# Altium schematic sheet Thermocouple-Sheet.SchDoc
size A4; DocumentNumber: 3; SheetNumber: 3; SheetTotal: 8
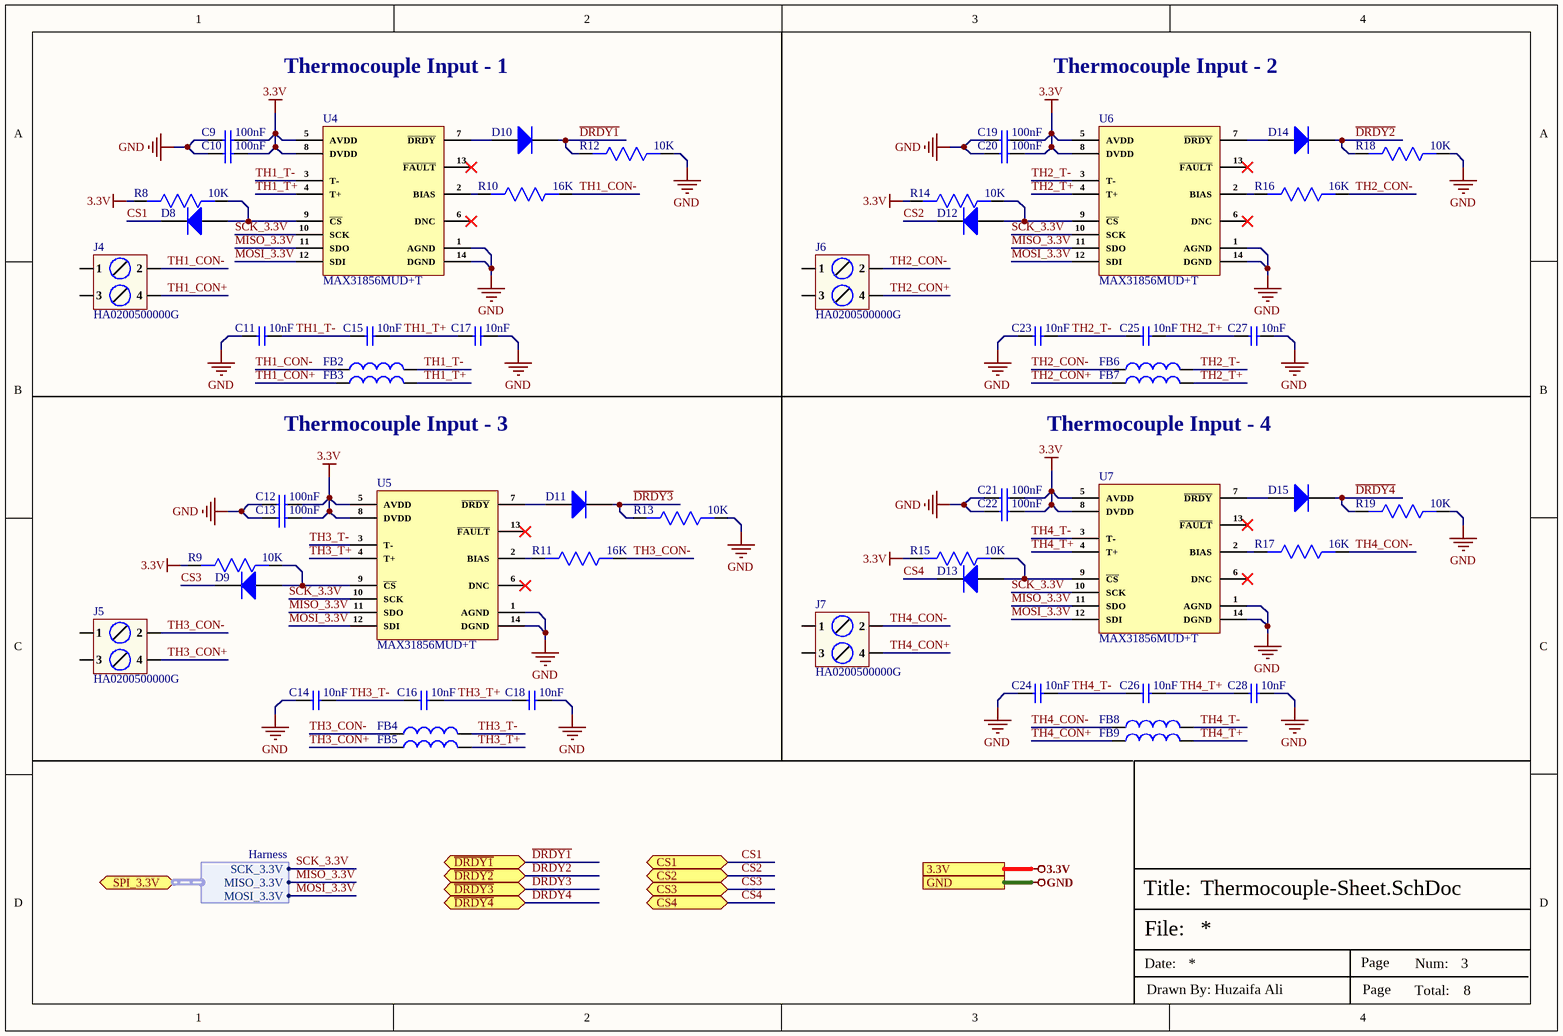
[diagram p0: Thermocouple-Sheet.SchDoc]

## Parts
C9  100nF  [Cap-0603]
C10  100nF  [Cap-0603]
C11  10nF  [Cap-0603]
C12  100nF  [Cap-0603]
C13  100nF  [Cap-0603]
C14  10nF  [Cap-0603]
C15  10nF  [Cap-0603]
C16  10nF  [Cap-0603]
C17  10nF  [Cap-0603]
C18  10nF  [Cap-0603]
C19  100nF  [Cap-0603]
C20  100nF  [Cap-0603]
C21  100nF  [Cap-0603]
C22  100nF  [Cap-0603]
C23  10nF  [Cap-0603]
C24  10nF  [Cap-0603]
C25  10nF  [Cap-0603]
C26  10nF  [Cap-0603]
C27  10nF  [Cap-0603]
C28  10nF  [Cap-0603]
D8  1N4148WS-7-F  [SOD-323]  (value not drawn)
D9  1N4148WS-7-F  [SOD-323]  (value not drawn)
D10  1N4148WS-7-F  [SOD-323]  (value not drawn)
D11  1N4148WS-7-F  [SOD-323]  (value not drawn)
D12  1N4148WS-7-F  [SOD-323]  (value not drawn)
D13  1N4148WS-7-F  [SOD-323]  (value not drawn)
D14  1N4148WS-7-F  [SOD-323]  (value not drawn)
D15  1N4148WS-7-F  [SOD-323]  (value not drawn)
FB2  MMZ2012R102ATD25  [Ind-0805]  (value not drawn)
FB3  MMZ2012R102ATD25  [Ind-0805]  (value not drawn)
FB4  MMZ2012R102ATD25  [Ind-0805]  (value not drawn)
FB5  MMZ2012R102ATD25  [Ind-0805]  (value not drawn)
FB6  MMZ2012R102ATD25  [Ind-0805]  (value not drawn)
FB7  MMZ2012R102ATD25  [Ind-0805]  (value not drawn)
FB8  MMZ2012R102ATD25  [Ind-0805]  (value not drawn)
FB9  MMZ2012R102ATD25  [Ind-0805]  (value not drawn)
J4  HA0200500000G  [HA0200500000G]
J5  HA0200500000G  [HA0200500000G]
J6  HA0200500000G  [HA0200500000G]
J7  HA0200500000G  [HA0200500000G]
R8  10K  [Res-0603]
R9  10K  [Res-0603]
R10  16K  [Res-0603]
R11  16K  [Res-0603]
R12  10K  [Res-0603]
R13  10K  [Res-0603]
R14  10K  [Res-0603]
R15  10K  [Res-0603]
R16  16K  [Res-0603]
R17  16K  [Res-0603]
R18  10K  [Res-0603]
R19  10K  [Res-0603]
U4  MAX31856MUD+T  [14-TSSOP]
U5  MAX31856MUD+T  [14-TSSOP]
U6  MAX31856MUD+T  [14-TSSOP]
U7  MAX31856MUD+T  [14-TSSOP]

## Ports
3.3V, CS1 (bidir), CS2 (bidir), CS3 (bidir), CS4 (bidir), GND, SPI_3.3V (bidir, harness Harness), ~{DRDY1} (bidir), ~{DRDY2} (bidir), ~{DRDY3} (bidir), ~{DRDY4} (bidir)

## Harnesses
Harness: SCK_3.3V, MISO_3.3V, MOSI_3.3V

## Nets
3.3V: C9.2 C10.2 C12.2 C13.2 C19.2 C20.2 C21.2 C22.2 R8.2 R9.2 R14.2 R15.2 U4.5(AVDD) U4.8(DVDD) U5.5(AVDD) U5.8(DVDD) U6.5(AVDD) U6.8(DVDD) U7.5(AVDD) U7.8(DVDD) ; port 3.3V
GND: C9.1 C10.1 C11.1 C12.1 C13.1 C14.1 C17.2 C18.2 C19.1 C20.1 C21.1 C22.1 C23.1 C24.1 C27.2 C28.2 R12.1 R13.1 R18.1 R19.1 U4.1(AGND) U4.14(DGND) U5.1(AGND) U5.14(DGND) U6.1(AGND) U6.14(DGND) U7.1(AGND) U7.14(DGND) ; port GND
CS1: D8.1(K) ; port CS1
CS2: D12.1(K) ; port CS2
CS3: D9.1(K) ; port CS3
CS4: D13.1(K) ; port CS4
~{DRDY1}: D10.1(K) R12.2 ; port ~{DRDY1}
~{DRDY2}: D14.1(K) R18.2 ; port ~{DRDY2}
~{DRDY3}: D11.1(K) R13.2 ; port ~{DRDY3}
~{DRDY4}: D15.1(K) R19.2 ; port ~{DRDY4}
MISO_3.3V: U4.11(SDO) U5.11(SDO) U6.11(SDO) U7.11(SDO) ; port SPI_3.3V.MISO_3.3V
MOSI_3.3V: U4.12(SDI) U5.12(SDI) U6.12(SDI) U7.12(SDI) ; port SPI_3.3V.MOSI_3.3V
SCK_3.3V: U4.10(SCK) U5.10(SCK) U6.10(SCK) U7.10(SCK) ; port SPI_3.3V.SCK_3.3V
TH1_CON+: FB3.1 J4.4
TH1_CON-: FB2.1 J4.2 R10.1
TH1_T+: C15.2 C17.1 FB3.2 U4.4(T+)
TH1_T-: C11.2 C15.1 FB2.2 U4.3(T-)
TH2_CON+: FB7.1 J6.4
TH2_CON-: FB6.1 J6.2 R16.1
TH2_T+: C25.2 C27.1 FB7.2 U6.4(T+)
TH2_T-: C23.2 C25.1 FB6.2 U6.3(T-)
TH3_CON+: FB5.1 J5.4
TH3_CON-: FB4.1 J5.2 R11.1
TH3_T+: C16.2 C18.1 FB5.2 U5.4(T+)
TH3_T-: C14.2 C16.1 FB4.2 U5.3(T-)
TH4_CON+: FB9.1 J7.4
TH4_CON-: FB8.1 J7.2 R17.1
TH4_T+: C26.2 C28.1 FB9.2 U7.4(T+)
TH4_T-: C24.2 C26.1 FB8.2 U7.3(T-)
NetD8_2: D8.2(A) R8.1 U4.9(~{CS})
NetD9_2: D9.2(A) R9.1 U5.9(~{CS})
NetD10_2: D10.2(A) U4.7(~{DRDY})
NetD11_2: D11.2(A) U5.7(~{DRDY})
NetD12_2: D12.2(A) R14.1 U6.9(~{CS})
NetD13_2: D13.2(A) R15.1 U7.9(~{CS})
NetD14_2: D14.2(A) U6.7(~{DRDY})
NetD15_2: D15.2(A) U7.7(~{DRDY})
NetR10_2: R10.2 U4.2(BIAS)
NetR11_2: R11.2 U5.2(BIAS)
NetR16_2: R16.2 U6.2(BIAS)
NetR17_2: R17.2 U7.2(BIAS)

Not connected (* = marked no-connect by the designer): J4 1 3; J5 1 3; J6 1 3; J7 1 3; U4 6(DNC)* 13(~{F}~{AULT})*; U5 6(DNC)* 13(~{F}~{AULT})*; U6 6(DNC)* 13(~{F}~{AULT})*; U7 6(DNC)* 13(~{F}~{AULT})*

## Notes on the sheet
- Thermocouple Input - 1
- Thermocouple Input - 2
- Thermocouple Input - 3
- Thermocouple Input - 4
- File:
- Title:
- Date:
- Page
- Num:
- Total:
- Drawn By: Huzaifa Ali

## Library data of the parts
C9 C10 C12 C13 C19-C22 = CC0603KRX5R9BB104: CAP CER 0.1UF 50V X5R 0603; Manufacturer: Yageo; Tolerance: 10%; Item Type: Capacitor; Supplier 1: Digi-Key; Manufacturer Part Number: CC0603KRX5R9BB104; RoHS: Yes; Category: Ceramic Capacitors; Stock 1: 152253; Pricing 1: 1=0.10000, 10=0.05200, 50=0.02820, 100=0.02310, 500=0.01648, 1000=0.01294 (USD); Mount: Surface Mount; Case/Package: 0603; Case Code (Imperial): 0603; Case Code (Metric): 1608; Weight: 7.1E-05oz; Min Operating Temperature: -55°C; Max Operating Temperature: 85°C; Capacitance: 100nF; Packaging: Tape and Reel; Voltage Rating: 50V; Dielectric: X5R; Termination: SMD/SMT; Voltage Rating (DC): 50V; Package Quantity: 4000; Length: 0.063inch; Width: 0.031inch; Thickness: 0.035inch; Lead Free: Lead Free; Halogen Free: Halogen Free; ComponentLink1URL: http://www.mouser.com/ds/2/447/Yageo_UPY-GP_NP0_16V-to-50V_9-358835.pdf?src-supplier=Mouser; ComponentLink1Description: http://www.mouser.com/ds/2/447/Yageo_UPY-GP_NP0_16V-to-50V_9-358835.pdf?src-supplier=Mouser; ComponentLink2URL: https://www.yageo.com/upload/media/product/productsearch/datasheet/mlcc/UPY-GPHC_X5R_4V-to-50V_26.pdf?src-supplier=Digi-Key; ComponentLink2Description: https://www.yageo.com/upload/media/product/productsearch/datasheet/mlcc/UPY-GPHC_X5R_4V-to-50V_26.pdf?src-supplier=Digi-Key; ComponentLink3URL: http://www.yageo.com/exep/pages/download/literatures/ProductSelectionGuide%202014_Final_2.pdf?src-supplier=Digi-Key; ComponentLink3Description: http://www.yageo.com/exep/pages/download/literatures/ProductSelectionGuide%202014_Final_2.pdf?src-supplier=Digi-Key; Supplier Part Number 1: 311-4046-1-ND; LCSC Part Number: C110022
C11 C14-C18 C23-C28 = CC0603KRX7R7BB103: CAP CER 10000PF 16V X7R 0603; Manufacturer: Yageo; Tolerance: 10%; Item Type: Capacitor; Supplier 1: Arrow Electronics; Manufacturer Part Number: CC0603KRX7R7BB103; RoHS: Yes; Category: Ceramic Capacitors; Stock 1: 3; Pricing 1: 1=0.03600 (USD); Mount: Surface Mount; Case/Package: 0603; Case Code (Imperial): 0603; Case Code (Metric): 1608; Min Operating Temperature: -55°C; Max Operating Temperature: 125°C; Capacitance: 10nF; Voltage Rating: 16V; Voltage Rating (DC): 16V; Packaging: Tape and Reel; Dielectric: X7R; Termination: SMD/SMT; Resistor Type: Ceramic; Series: CC; Construction: Flat; Length: 1.6mm; Width: 0.8mm; Height: 0.8mm; Thickness: 0.035inch; Depth: 0.8mm; Radiation Hardening: No; Lead Free: Lead Free; Halogen Free: Halogen Free; RoHS Compliant: Yes; ComponentLink1URL: https://datasheet.ciiva.com/7978/1489800-7978139.pdf?src-supplier=Element14; ComponentLink1Description: https://datasheet.ciiva.com/7978/1489800-7978139.pdf?src-supplier=Element14; Supplier Part Number 1: CC0603KRX7R7BB103; LCSC Part Number: C519406
D8-D15 = 1N4148WS-7-F: DIODE GEN PURP 75V 150MA SOD323; Manufacturer: Diodes; Forward Current: 300mA; Reverse Recovery Time: 4ns; Element Configuration: Single; Forward Voltage: 1.25V; Max Reverse Current: 1uA; Peak Non-Repetitive Surge Current: 2A; Power Dissipation: 200mW; Polarity: Standard; Capacitance: 2pF; Supplier 1: Mouser; Manufacturer Part Number: 1N4148WS-7-F; RoHS: Yes; Category: Rectifier Diodes; Pricing 1: 1=0.19000, 10=0.17500, 50=0.17500, 100=0.09600, 500=0.05900, 1000=0.04000, 3000=0.03000, 9000=0.02600, 10000=0.02600, 24000=0.02300, 45000=0.01900 (USD); Mount: Surface Mount; Number of Pins: 2; Weight: 0.000173oz; Contact Plating: Tin,Matte; Min Operating Temperature: -65°C; Max Operating Temperature: 150°C; Max Repetitive Reverse Voltage (Vrrm): 75V; Max Forward Surge Current (Ifsm): 2A; Max Surge Current: 2A; Packaging: Tape and Reel; Recovery Time: 4ns; Package Quantity: 3000; Average Rectified Current: 150mA; Voltage Rating (DC): 75V; Power Rating: 200mW; Current Rating: 150mA; Output Current: 150mA; Voltage: 75V; Max Reverse Voltage (DC): 75V; Series: -; Reverse Recovery Time-Max: 4ns; Length: 1.8mm; Width: 1.4mm; Height: 1mm; Radiation Hardening: No; REACH SVHC: No SVHC; Lead Free: Lead Free; RoHS Compliant: Yes; ComponentLink1URL: https://datasheet.ciiva.com/1179/ds30097-1179355.pdf?src-supplier=Element14; ComponentLink1Description: https://datasheet.ciiva.com/1179/ds30097-1179355.pdf?src-supplier=Element14; ComponentLink2URL: https://datasheet.ciiva.com/8300/ds30097-8300396.pdf?src-supplier=Avnet; ComponentLink2Description: https://datasheet.ciiva.com/8300/ds30097-8300396.pdf?src-supplier=Avnet; ComponentLink3URL: https://datasheet.ciiva.com/16199/ds30097-16199061.pdf?src-supplier=Future+Electronics; ComponentLink3Description: https://datasheet.ciiva.com/16199/ds30097-16199061.pdf?src-supplier=Future+Electronics; ComponentLink4URL: https://datasheet.ciiva.com/911/ds30097-911742.pdf?src-supplier=Digi-Key; ComponentLink4Description: https://datasheet.ciiva.com/911/ds30097-911742.pdf?src-supplier=Digi-Key; ComponentLink5URL: https://datasheet.ciiva.com/911/ds30097-911743.pdf?src-supplier=Digi-Key; ComponentLink5Description: https://datasheet.ciiva.com/911/ds30097-911743.pdf?src-supplier=Digi-Key; ComponentLink6URL: https://datasheet.ciiva.com/911/ds30097-911741.pdf?src-supplier=Digi-Key; ComponentLink6Description: https://datasheet.ciiva.com/911/ds30097-911741.pdf?src-supplier=Digi-Key; Supplier Part Number 1: 621-1N4148WS-F; LCSC Part Number: C60580; Item Type: Diode
FB2-FB9 = MMZ2012R102ATD25: FERRITE BEAD 1K OHM 0805 1LN; Manufacturer: TDK; Number of Lines: 1; Max Current Rating: 500mA; DC Resistance (DCR): 300mR; Impedance: 1kR; Tolerance: 25%; Test Frequency: 100MHz; Supplier 1: Digi-Key; Manufacturer Part Number: MMZ2012R102ATD25; RoHS: Yes; Category: Ferrite Beads and Chips; Stock 1: 2942; Pricing 1: 1=0.11000, 10=0.09200, 25=0.08280, 50=0.06080, 100=0.05240, 250=0.04140, 500=0.03496, 1000=0.02944 (USD); Mount: Surface Mount; Case/Package: 0805; Case Code (Metric): 2012; Case Code (Imperial): 0805; Weight: 0.000194oz; Min Operating Temperature: -55°C; Max Operating Temperature: 125°C; Package Quantity: 4000; Packaging: Tape and Reel; Termination: SMD/SMT; Max DC Current: 500mA; Length: 0.079inch; Width: 0.049inch; Height: 0.041inch; Ratings: AEC-Q200; RoHS Compliant: Yes; ComponentLink1URL: http://www.mouser.com/ds/2/400/beads_automotive_signal_mmz_en-469244.pdf?src-supplier=Mouser; ComponentLink1Description: http://www.mouser.com/ds/2/400/beads_automotive_signal_mmz_en-469244.pdf?src-supplier=Mouser; ComponentLink2URL: https://product.tdk.com/info/en/catalog/datasheets/beads_automotive_signal_mmz2012_en.pdf?src-supplier=Digi-Key; ComponentLink2Description: https://product.tdk.com/info/en/catalog/datasheets/beads_automotive_signal_mmz2012_en.pdf?src-supplier=Digi-Key; Supplier Part Number 1: 445-MMZ2012R102ATD25CT-ND; LCSC Part Number: C307765; Item Type: Ferrite Bead
J4-J7 = HA0200500000G: TERM BLK 2POS TOP ENT 5.08MM PCB; Manufacturer: Amphenol; Item Type: Terminal Block; Supplier 1: Arrow Electronics; Manufacturer Part Number: HA0200500000G; RoHS: Yes; Stock 1: 120; Pricing 1: 2160=0.34600, 2520=0.34400, 3600=0.29460, 9000=0.29270, 18000=0.29070, 45000=0.28890, 90000=0.28680 (USD); Terminal and Terminal Block Type: BARRIER STRIP TERMINAL BLOCK; RoHS Compliant: Yes; Reach SVHC Compliant: Yes; ComponentLink1URL: https://datasheet.ciiva.com:443/pdfs/VipMasterIC/IC/AMPH/AMPH-S-A0005047712/AMPH-S-A0005047712-1.pdf?src-supplier=IHS+Markit; ComponentLink1Description: https://datasheet.ciiva.com:443/pdfs/VipMasterIC/IC/AMPH/AMPH-S-A0005047712/AMPH-S-A0005047712-1.pdf?src-supplier=IHS+Markit; Supplier Part Number 1: HA0200500000G; LCSC Part Number: C967080
R8 R9 R12-R15 R18 R19 = RC0603FR-0710KL: RES SMD 10K Ohm 1% 1/10W 0603; Manufacturer: Yageo; Resistance: 10kR; Temperature Coefficient: 100ppm/°C; Voltage Rating (DC): 50V; Power Rating: 100mW; Voltage Rating: 75V; Supplier 1: Digi-Key; Manufacturer Part Number: RC0603FR-0710KL; RoHS: Yes; Category: Chip SMD Resistors; Stock 1: 25249139; Pricing 1: 1=0.10000, 10=0.02400, 100=0.00970, 1000=0.00436, 2500=0.00378 (USD); Case/Package: 0603; Number of Pins: 2; Case Code (Imperial): 0603; Case Code (Metric): 1608; Weight: 7.1E-05oz; Size Code: 0603; Min Operating Temperature: -55°C; Max Operating Temperature: 155°C; Tolerance: 1%; Resistor Type: Thick Film; Packaging: Tape and Reel; Termination: SMD/SMT; Features: Moisture Resistant; Series: RC; Max Power Dissipation: 100mW; Number of Terminations: 2; Resistance Tolerance: 1%; Construction: Rectangular; Length: 1.6mm; Width: 0.8mm; Height: 0.45mm; Depth: 0.8mm; Lead Pitch: 0.3mm; REACH SVHC: Unknown; Lead Free: Lead Free; Military Standard: Not; RoHS Compliant: Yes; ComponentLink1URL: https://datasheet.ciiva.com/7660/38590-7660789.pdf?src-supplier=Element14; ComponentLink1Description: https://datasheet.ciiva.com/7660/38590-7660789.pdf?src-supplier=Element14; ComponentLink2URL: https://datasheet.ciiva.com/7983/443971-7983596.pdf?src-supplier=Element14; ComponentLink2Description: https://datasheet.ciiva.com/7983/443971-7983596.pdf?src-supplier=Element14; ComponentLink3URL: https://datasheet.ciiva.com/22747/443971-22747519.pdf?src-supplier=Element14; ComponentLink3Description: https://datasheet.ciiva.com/22747/443971-22747519.pdf?src-supplier=Element14; ComponentLink4URL: https://datasheet.ciiva.com/46440/1868787-46440891.pdf?src-supplier=Element14; ComponentLink4Description: https://datasheet.ciiva.com/46440/1868787-46440891.pdf?src-supplier=Element14; ComponentLink5URL: https://datasheet.ciiva.com/7746/1738695-7746239.pdf?src-supplier=Element14; ComponentLink5Description: https://datasheet.ciiva.com/7746/1738695-7746239.pdf?src-supplier=Element14; ComponentLink6URL: https://datasheet.ciiva.com/15189/getdatasheetpartid-409289-15189591.pdf?src-supplier=Verical; ComponentLink6Description: https://datasheet.ciiva.com/15189/getdatasheetpartid-409289-15189591.pdf?src-supplier=Verical; Supplier Part Number 1: 311-10.0KHRCT-ND; LCSC Part Number: C98220
R10 R11 R16 R17 = RC0603DR-0716KL: RES 16K OHM 0.5% 1/10W 0603; Manufacturer: Yageo; Resistance: 16kR; Max Power Dissipation: 100mW; Temperature Coefficient: 100ppm/°C; Item Type: Resistor; Supplier 1: Avnet; Manufacturer Part Number: RC0603DR-0716KL; RoHS: Yes; Category: Chip SMD Resistors; Pricing 1: 5000=0.00430, 10000=0.00424, 20000=0.00411 (USD); Case/Package: 0603; Min Operating Temperature: -55°C; Max Operating Temperature: 155°C; Tolerance: 0.5%; Packaging: Tape and Reel; Resistor Type: Thick Film; Number of Terminations: 2; Features: Moisture Resistant; Length: 0.063inch; Width: 0.031inch; Height: 0.022inch; RoHS Compliant: Yes; ComponentLink1URL: http://www.yageo.com.tw/exep/pages/download/literatures/PYu-R_INT-thick_7.pdf?src-supplier=Digi-Key; ComponentLink1Description: http://www.yageo.com.tw/exep/pages/download/literatures/PYu-R_INT-thick_7.pdf?src-supplier=Digi-Key; Supplier Part Number 1: RC0603DR-0716KL; LCSC Part Number: C327136
U4-U7 = MAX31856MUD+T: IC CONV THERMOCOUPLE 14TSSOP; Manufacturer: Maxim; Interface: SPI; Operating Supply Current: 1.2mA; Output Type: Digital; Supplier 1: Arrow Electronics; Manufacturer Part Number: MAX31856MUD+T; RoHS: Yes; Category: Interface ICs; Stock 1: 2890; Pricing 1: 1=10.21890, 10=9.52090, 25=9.06320, 100=7.80510, 250=7.38990, 500=6.66890, 1000=6.39750, 3000=6.32960 (USD); Mount: Surface Mount; Case/Package: TSSOP; Number of Pins: 14; Min Operating Temperature: -55°C; Max Operating Temperature: 125°C; Packaging: Tape and Reel; RoHS Compliant: Yes; ComponentLink1URL: https://media.digikey.com/pdf/Data%20Sheets/Maxim%20PDFs/PartNumberBreakdown_ds.pdf?src-supplier=Digi-Key; ComponentLink1Description: https://media.digikey.com/pdf/Data%20Sheets/Maxim%20PDFs/PartNumberBreakdown_ds.pdf?src-supplier=Digi-Key; ComponentLink2URL: http://datasheets.maximintegrated.com/en/ds/MAX31856.pdf?src-supplier=Avnet; ComponentLink2Description: http://datasheets.maximintegrated.com/en/ds/MAX31856.pdf?src-supplier=Avnet; Supplier Part Number 1: MAX31856MUD+T; LCSC Part Number: C2653162; Item Type: IC